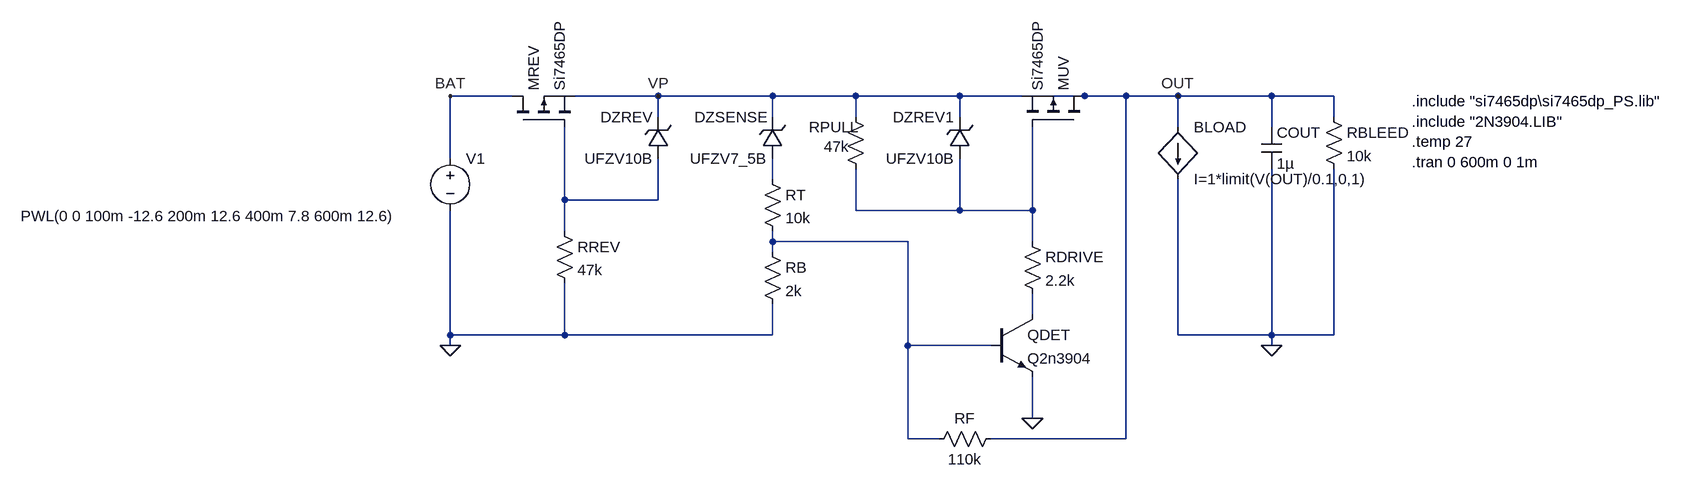
[diagram p0: schematic simulation.asc]
simulation.asc, the LTspice schematic file:
Version 4.1
SHEET 1 2504 680
WIRE 128 16 32 16
WIRE 352 16 224 16
WIRE 528 16 352 16
WIRE 656 16 528 16
WIRE 816 16 656 16
WIRE 912 16 816 16
WIRE 1008 16 944 16
WIRE 1072 16 1008 16
WIRE 1152 16 1072 16
WIRE 1296 16 1152 16
WIRE 1392 16 1296 16
WIRE 352 48 352 16
WIRE 528 48 528 16
WIRE 656 48 656 16
WIRE 816 48 816 16
WIRE 1392 48 1392 16
WIRE 1152 64 1152 16
WIRE 1296 64 1296 16
WIRE 32 112 32 16
WIRE 528 144 528 112
WIRE 208 176 208 64
WIRE 352 176 352 112
WIRE 352 176 208 176
WIRE 656 192 656 128
WIRE 816 192 816 112
WIRE 816 192 656 192
WIRE 928 192 928 64
WIRE 928 192 816 192
WIRE 208 224 208 176
WIRE 528 240 528 224
WIRE 736 240 528 240
WIRE 928 240 928 192
WIRE 528 256 528 240
WIRE 928 352 928 320
WIRE 32 384 32 192
WIRE 208 384 208 304
WIRE 208 384 32 384
WIRE 528 384 528 336
WIRE 528 384 208 384
WIRE 1152 384 1152 144
WIRE 1296 384 1296 128
WIRE 1296 384 1152 384
WIRE 1392 384 1392 128
WIRE 1392 384 1296 384
WIRE 32 400 32 384
WIRE 736 400 736 240
WIRE 864 400 736 400
WIRE 1296 400 1296 384
WIRE 928 512 928 448
WIRE 736 544 736 400
WIRE 784 544 736 544
WIRE 1072 544 1072 16
WIRE 1072 544 864 544
FLAG 32 400 0
FLAG 1296 400 0
FLAG 928 512 0
FLAG 32 16 BAT
FLAG 352 16 VP
FLAG 1152 16 OUT
SYMBOL voltage 32 96 R0
WINDOW 3 -661 105 Left 2
WINDOW 123 0 0 Left 0
WINDOW 39 0 0 Left 0
SYMATTR InstName V1
SYMATTR Value PWL(0 0 100m -12.6 200m 12.6 400m 7.8 600m 12.6)
SYMBOL pmos 128 64 R270
SYMATTR InstName MREV
SYMATTR Value Si7465DP
SYMATTR Prefix x
SYMBOL res 192 208 R0
SYMATTR InstName RREV
SYMATTR Value 47k
SYMBOL res 512 240 R0
SYMATTR InstName RB
SYMATTR Value 2k
SYMBOL res 512 128 R0
SYMATTR InstName RT
SYMATTR Value 10k
SYMBOL res 640 32 R0
WINDOW 0 -56 32 Left 2
WINDOW 3 -33 62 Left 2
SYMATTR InstName RPULL
SYMATTR Value 47k
SYMBOL res 1376 32 R0
SYMATTR InstName RBLEED
SYMATTR Value 10k
SYMBOL cap 1280 64 R0
SYMATTR InstName COUT
SYMATTR Value 1µ
SYMBOL npn 864 352 R0
SYMATTR InstName QDET
SYMATTR Value Q2n3904
SYMATTR Prefix Q
SYMBOL zener 368 112 R180
WINDOW 0 24 64 Left 2
WINDOW 3 24 0 Left 2
SYMATTR InstName DZREV
SYMATTR Value UFZV10B
SYMBOL zener 544 112 R180
WINDOW 0 24 64 Left 2
WINDOW 3 24 0 Left 2
SYMATTR InstName DZSENSE
SYMATTR Value UFZV7_5B
SYMBOL res 880 528 R90
WINDOW 0 0 56 VBottom 2
WINDOW 3 32 56 VTop 2
SYMATTR InstName RF
SYMATTR Value 110k
SYMBOL zener 832 112 R180
WINDOW 0 24 64 Left 2
WINDOW 3 24 0 Left 2
SYMATTR InstName DZREV1
SYMATTR Value UFZV10B
SYMBOL bi 1152 64 R0
SYMATTR InstName BLOAD
SYMATTR Value I=1*limit(V(OUT)/0.1,0,1)
SYMBOL pmos 1008 64 M270
SYMATTR InstName MUV
SYMATTR Value Si7465DP
SYMATTR Prefix x
SYMBOL res 912 224 R0
SYMATTR InstName RDRIVE
SYMATTR Value 2.2k
TEXT 1512 24 Left 2 !.include "si7465dp\\si7465dp_PS.lib"\n.include "2N3904.LIB"\n.temp 27\n.tran 0 600m 0 1m

The netlist it stands for:
* simulation.asc
V1 BAT 0 PWL(0 0 100m -12.6 200m 12.6 400m 7.8 600m 12.6)
X§MREV BAT N002 VP Si7465DP  ; pins D G S
RREV N002 0 47k
RB N004 0 2k
RT N001 N004 10k
RPULL VP N003 47k
RBLEED OUT 0 10k
COUT OUT 0 1µ
QDET N005 N004 0 0 Q2n3904
DZREV N002 VP UFZV10B
DZSENSE N001 VP UFZV7_5B
RF OUT N004 110k
DZREV1 N003 VP UFZV10B
BLOAD OUT 0 I=1*limit(V(OUT)/0.1,0,1)
X§MUV OUT N003 VP Si7465DP  ; pins D G S
RDRIVE N003 N005 2.2k
.model D D
.lib standard.dio
.model NPN NPN
.model PNP PNP
.lib standard.bjt
.include "si7465dp\si7465dp_PS.lib"
.include "2N3904.LIB"
.temp 27
.tran 0 600m 0 1m
.backanno
.end